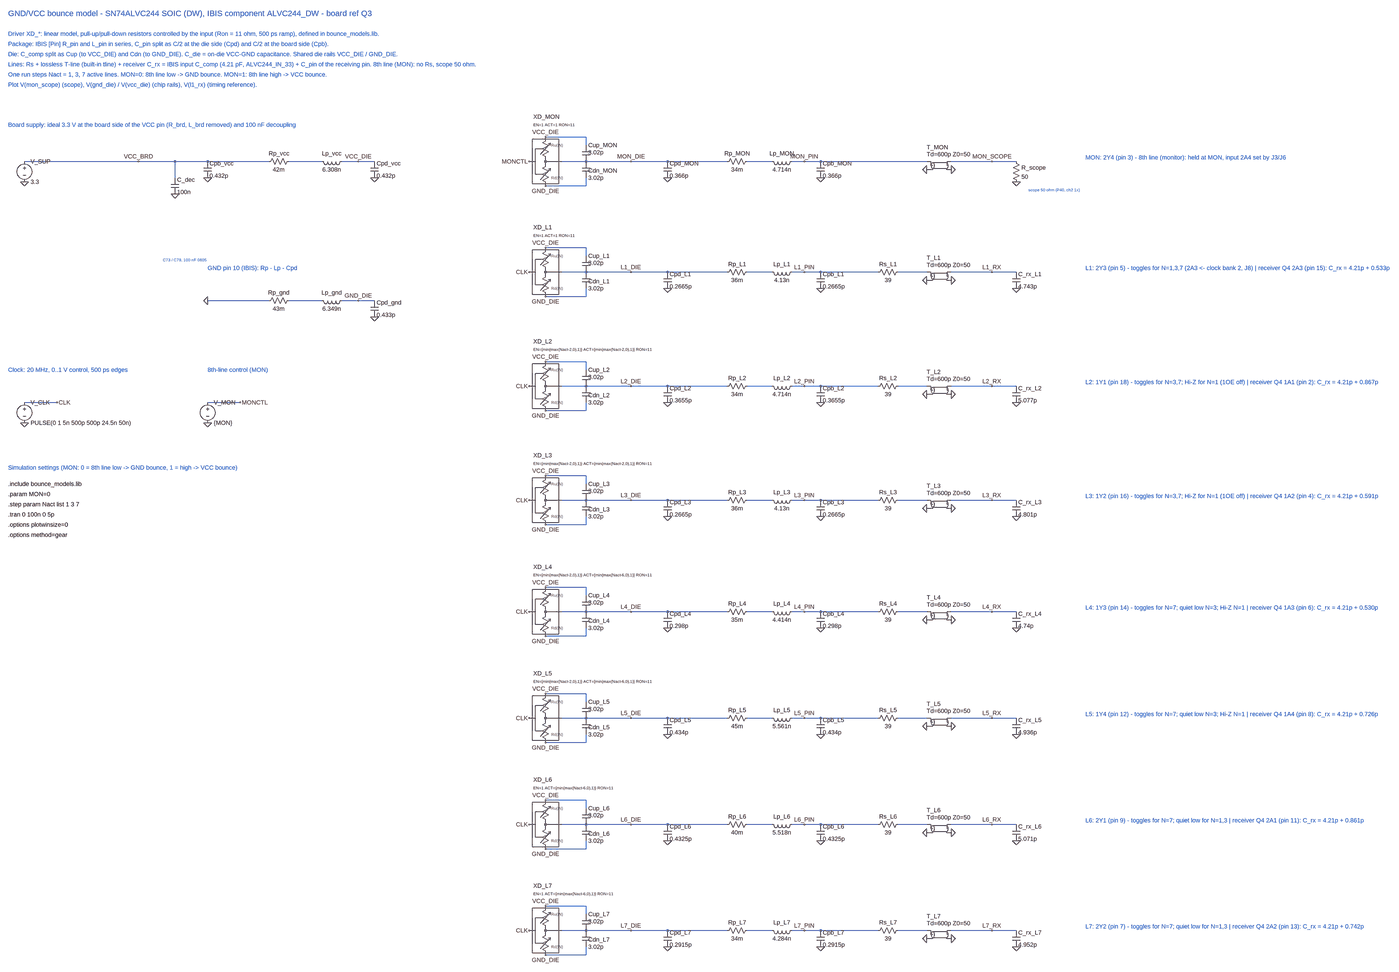
[diagram p0: schematic GND_VCC_bounce_SOIC.asc, whole sheet]
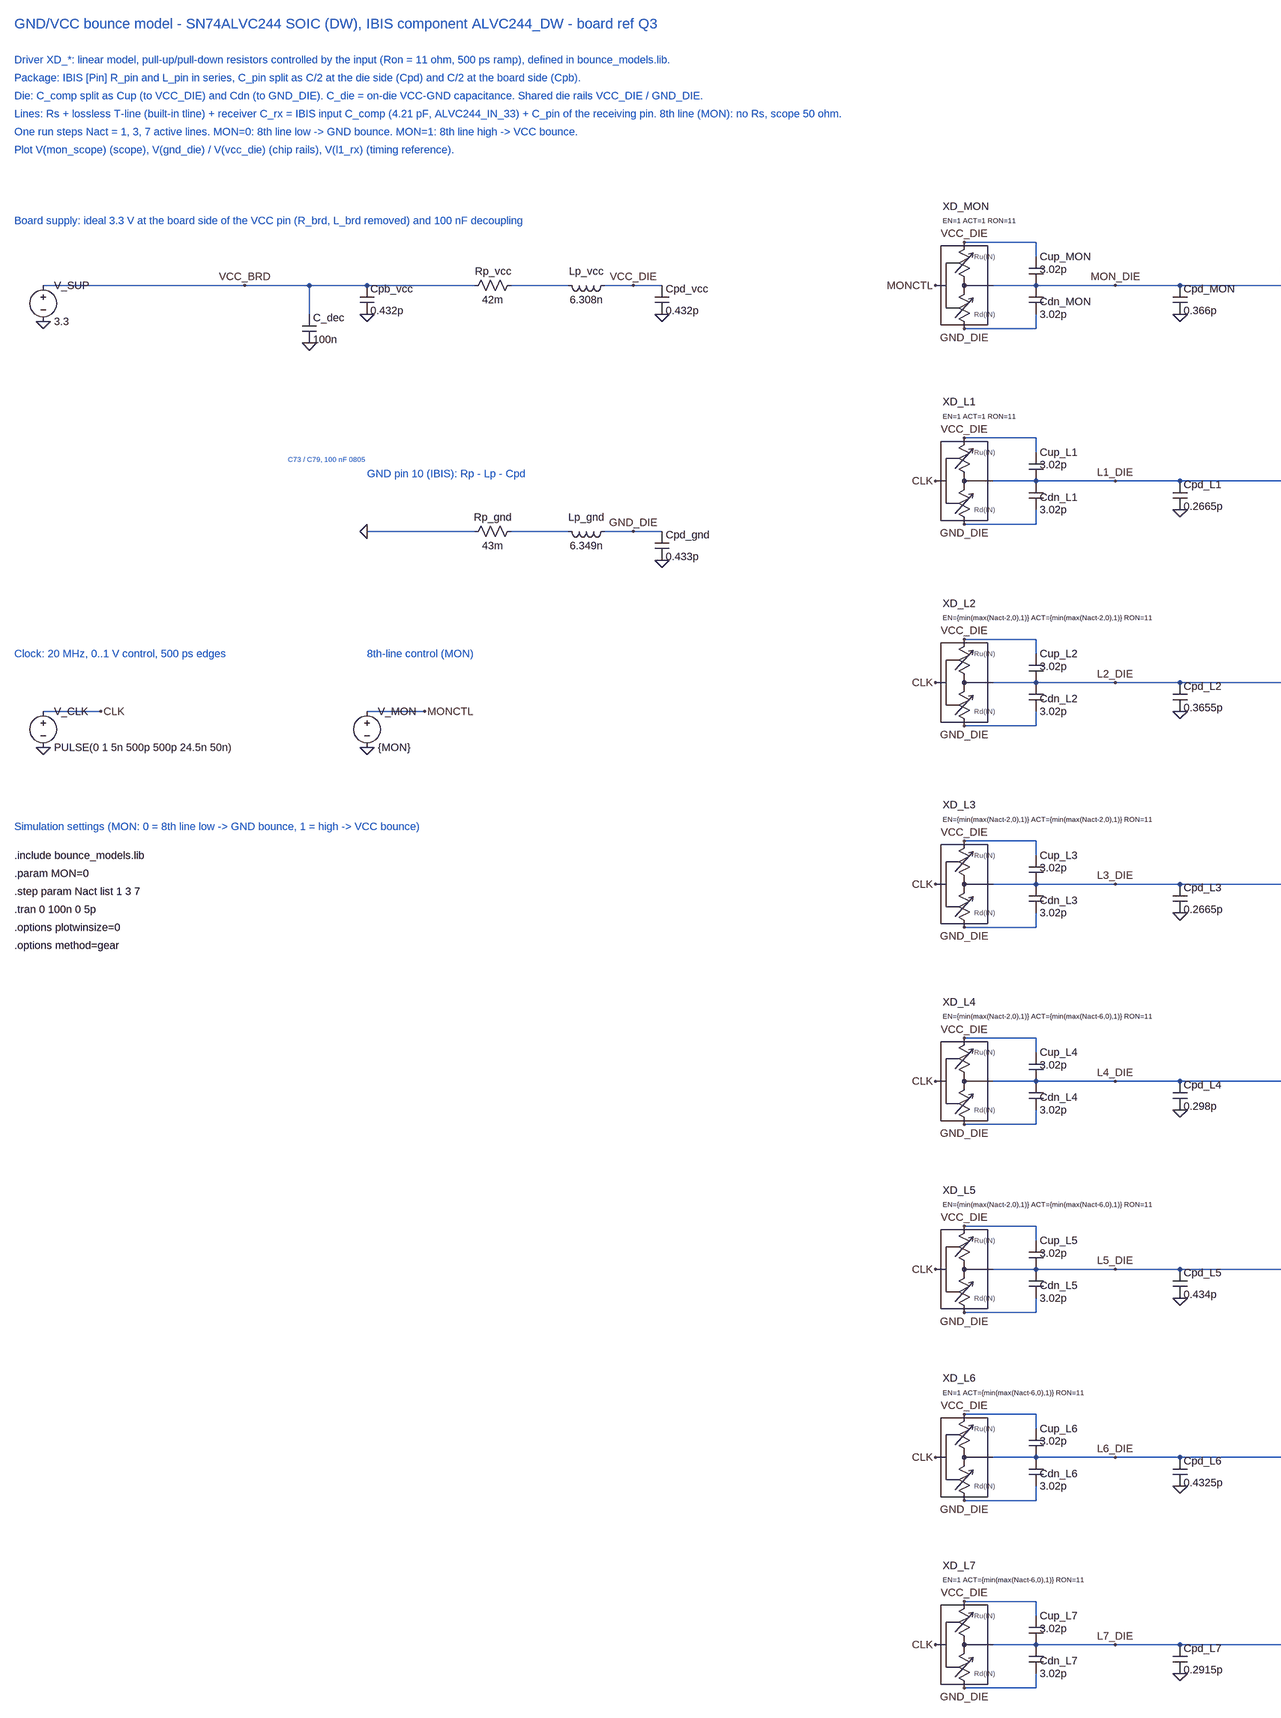
[diagram p1: schematic GND_VCC_bounce_SOIC.asc, part, row 1 of 1, column 1 of 2]
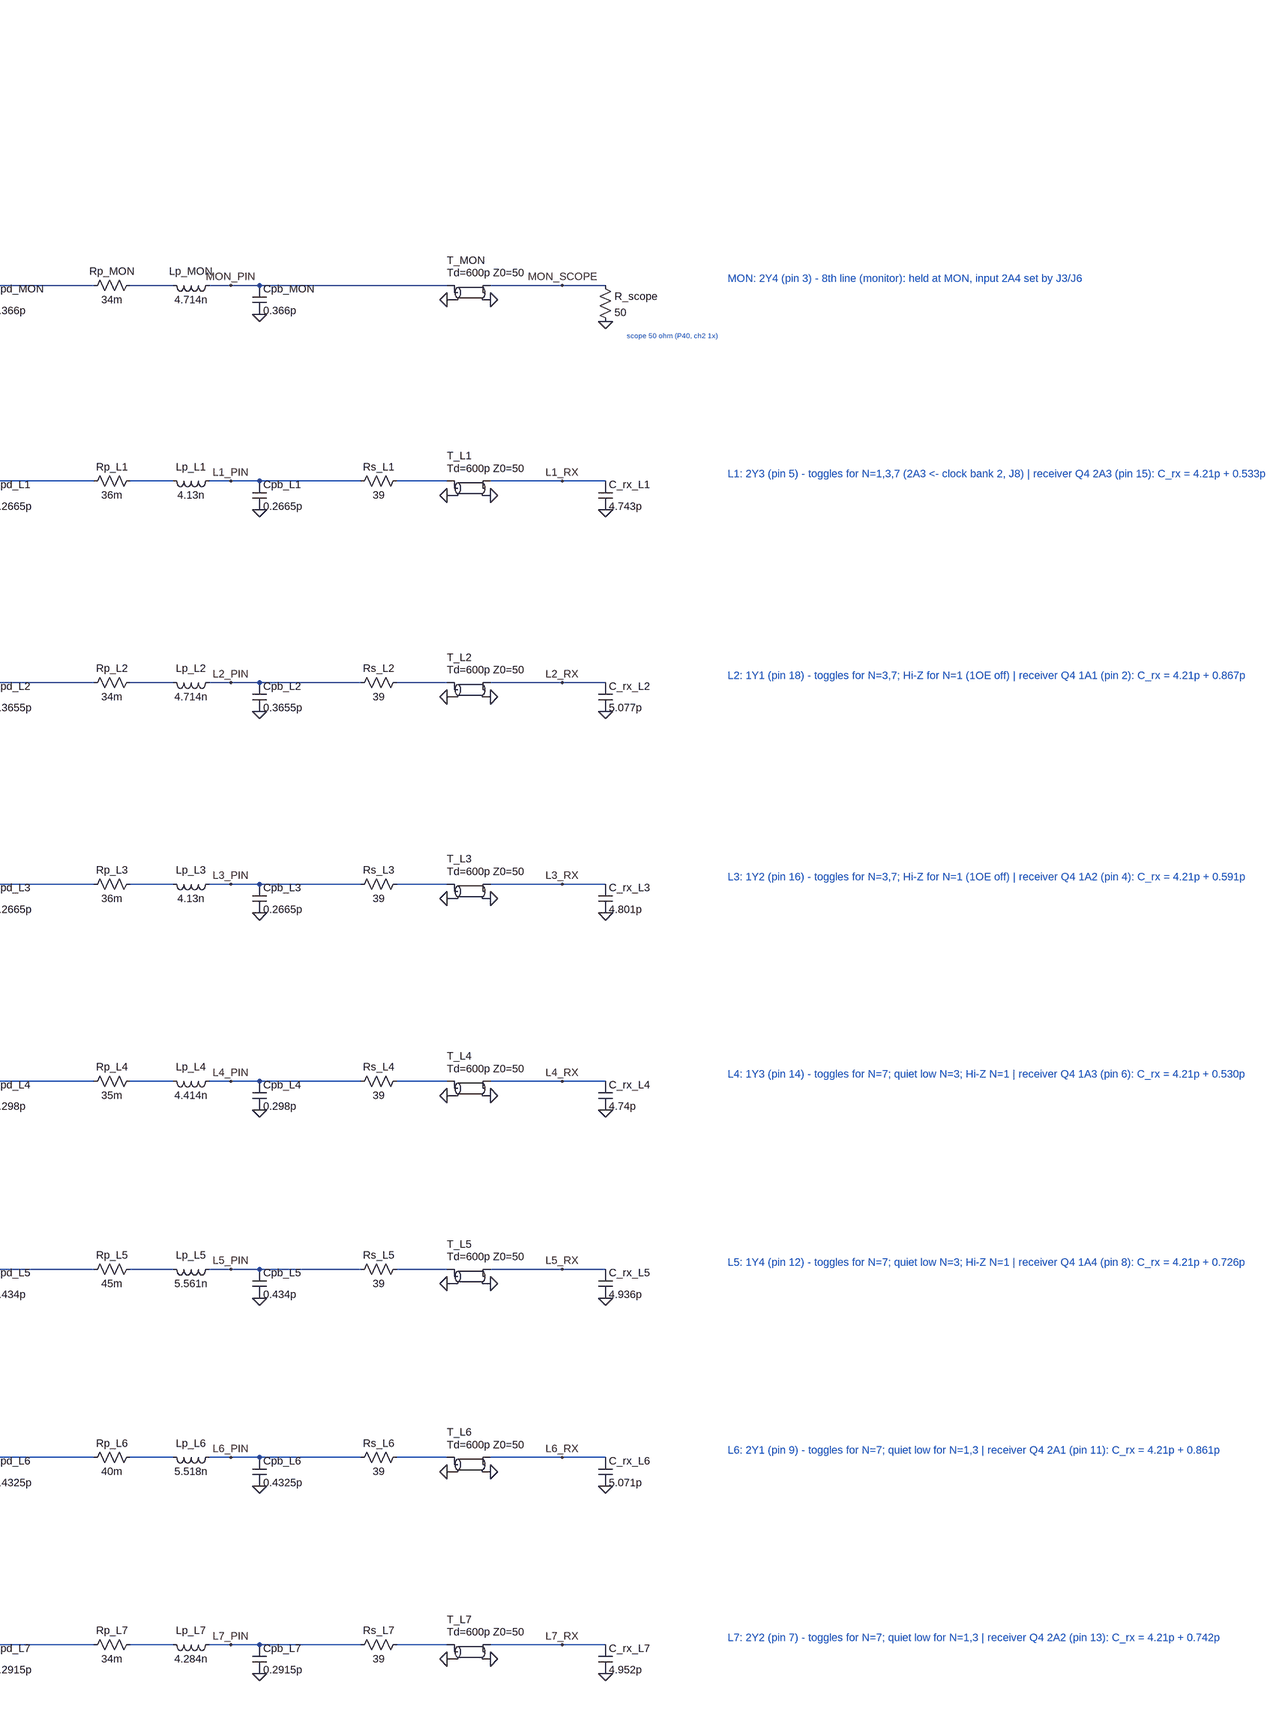
[diagram p2: schematic GND_VCC_bounce_SOIC.asc, part, row 1 of 1, column 2 of 2]
GND_VCC_bounce_SOIC.asc, the LTspice schematic file:
Version 4.1
SHEET 1 5576 3600
WIRE 2272 64 2112 64
WIRE 2272 96 2272 64
WIRE 512 160 64 160
WIRE 656 160 512 160
WIRE 784 160 656 160
WIRE 1024 160 784 160
WIRE 1232 160 1104 160
WIRE 1376 160 1312 160
WIRE 1440 160 1376 160
WIRE 2272 160 2176 160
WIRE 2448 160 2272 160
WIRE 2592 160 2448 160
WIRE 2832 160 2592 160
WIRE 3008 160 2912 160
WIRE 3136 160 3088 160
WIRE 3200 160 3136 160
WIRE 3632 160 3200 160
WIRE 3888 160 3728 160
WIRE 3984 160 3888 160
WIRE 656 224 656 160
WIRE 2272 256 2272 224
WIRE 2272 256 2112 256
WIRE 2272 512 2112 512
WIRE 2272 544 2272 512
WIRE 2272 608 2176 608
WIRE 2448 608 2272 608
WIRE 2592 608 2448 608
WIRE 2832 608 2592 608
WIRE 3008 608 2912 608
WIRE 3136 608 3088 608
WIRE 3200 608 3136 608
WIRE 3440 608 3200 608
WIRE 3632 608 3520 608
WIRE 3888 608 3728 608
WIRE 3984 608 3888 608
WIRE 2272 704 2272 672
WIRE 2272 704 2112 704
WIRE 1024 720 784 720
WIRE 1232 720 1104 720
WIRE 1376 720 1312 720
WIRE 1440 720 1376 720
WIRE 2272 960 2112 960
WIRE 2272 992 2272 960
WIRE 2272 1056 2176 1056
WIRE 2448 1056 2272 1056
WIRE 2592 1056 2448 1056
WIRE 2832 1056 2592 1056
WIRE 3008 1056 2912 1056
WIRE 3136 1056 3088 1056
WIRE 3200 1056 3136 1056
WIRE 3440 1056 3200 1056
WIRE 3632 1056 3520 1056
WIRE 3888 1056 3728 1056
WIRE 3984 1056 3888 1056
WIRE 192 1120 64 1120
WIRE 912 1120 784 1120
WIRE 2272 1152 2272 1120
WIRE 2272 1152 2112 1152
WIRE 2272 1408 2112 1408
WIRE 2272 1440 2272 1408
WIRE 2272 1504 2176 1504
WIRE 2448 1504 2272 1504
WIRE 2592 1504 2448 1504
WIRE 2832 1504 2592 1504
WIRE 3008 1504 2912 1504
WIRE 3136 1504 3088 1504
WIRE 3200 1504 3136 1504
WIRE 3440 1504 3200 1504
WIRE 3632 1504 3520 1504
WIRE 3888 1504 3728 1504
WIRE 3984 1504 3888 1504
WIRE 2272 1600 2272 1568
WIRE 2272 1600 2112 1600
WIRE 2272 1856 2112 1856
WIRE 2272 1888 2272 1856
WIRE 2272 1952 2176 1952
WIRE 2448 1952 2272 1952
WIRE 2592 1952 2448 1952
WIRE 2832 1952 2592 1952
WIRE 3008 1952 2912 1952
WIRE 3136 1952 3088 1952
WIRE 3200 1952 3136 1952
WIRE 3440 1952 3200 1952
WIRE 3632 1952 3520 1952
WIRE 3888 1952 3728 1952
WIRE 3984 1952 3888 1952
WIRE 2272 2048 2272 2016
WIRE 2272 2048 2112 2048
WIRE 2272 2304 2112 2304
WIRE 2272 2336 2272 2304
WIRE 2272 2400 2176 2400
WIRE 2448 2400 2272 2400
WIRE 2592 2400 2448 2400
WIRE 2832 2400 2592 2400
WIRE 3008 2400 2912 2400
WIRE 3136 2400 3088 2400
WIRE 3200 2400 3136 2400
WIRE 3440 2400 3200 2400
WIRE 3632 2400 3520 2400
WIRE 3888 2400 3728 2400
WIRE 3984 2400 3888 2400
WIRE 2272 2496 2272 2464
WIRE 2272 2496 2112 2496
WIRE 2272 2752 2112 2752
WIRE 2272 2784 2272 2752
WIRE 2272 2848 2176 2848
WIRE 2448 2848 2272 2848
WIRE 2592 2848 2448 2848
WIRE 2832 2848 2592 2848
WIRE 3008 2848 2912 2848
WIRE 3136 2848 3088 2848
WIRE 3200 2848 3136 2848
WIRE 3440 2848 3200 2848
WIRE 3632 2848 3520 2848
WIRE 3888 2848 3728 2848
WIRE 3984 2848 3888 2848
WIRE 2272 2944 2272 2912
WIRE 2272 2944 2112 2944
WIRE 2272 3200 2112 3200
WIRE 2272 3232 2272 3200
WIRE 2272 3296 2176 3296
WIRE 2448 3296 2272 3296
WIRE 2592 3296 2448 3296
WIRE 2832 3296 2592 3296
WIRE 3008 3296 2912 3296
WIRE 3136 3296 3088 3296
WIRE 3200 3296 3136 3296
WIRE 3440 3296 3200 3296
WIRE 3632 3296 3520 3296
WIRE 3888 3296 3728 3296
WIRE 3984 3296 3888 3296
WIRE 2272 3392 2272 3360
WIRE 2272 3392 2112 3392
FLAG 64 240 0
FLAG 512 160 VCC_BRD
FLAG 656 288 0
FLAG 784 224 0
FLAG 1376 160 VCC_DIE
FLAG 1440 224 0
FLAG 784 720 0
FLAG 1376 720 GND_DIE
FLAG 1440 784 0
FLAG 64 1200 0
FLAG 192 1120 CLK
FLAG 784 1200 0
FLAG 912 1120 MONCTL
FLAG 2048 160 MONCTL
FLAG 2112 64 VCC_DIE
FLAG 2112 256 GND_DIE
FLAG 2448 160 MON_DIE
FLAG 2592 224 0
FLAG 3136 160 MON_PIN
FLAG 3200 224 0
FLAG 3632 192 0
FLAG 3728 192 0
FLAG 3888 160 MON_SCOPE
FLAG 3984 240 0
FLAG 2048 608 CLK
FLAG 2112 512 VCC_DIE
FLAG 2112 704 GND_DIE
FLAG 2448 608 L1_DIE
FLAG 2592 672 0
FLAG 3136 608 L1_PIN
FLAG 3200 672 0
FLAG 3632 640 0
FLAG 3728 640 0
FLAG 3888 608 L1_RX
FLAG 3984 672 0
FLAG 2048 1056 CLK
FLAG 2112 960 VCC_DIE
FLAG 2112 1152 GND_DIE
FLAG 2448 1056 L2_DIE
FLAG 2592 1120 0
FLAG 3136 1056 L2_PIN
FLAG 3200 1120 0
FLAG 3632 1088 0
FLAG 3728 1088 0
FLAG 3888 1056 L2_RX
FLAG 3984 1120 0
FLAG 2048 1504 CLK
FLAG 2112 1408 VCC_DIE
FLAG 2112 1600 GND_DIE
FLAG 2448 1504 L3_DIE
FLAG 2592 1568 0
FLAG 3136 1504 L3_PIN
FLAG 3200 1568 0
FLAG 3632 1536 0
FLAG 3728 1536 0
FLAG 3888 1504 L3_RX
FLAG 3984 1568 0
FLAG 2048 1952 CLK
FLAG 2112 1856 VCC_DIE
FLAG 2112 2048 GND_DIE
FLAG 2448 1952 L4_DIE
FLAG 2592 2016 0
FLAG 3136 1952 L4_PIN
FLAG 3200 2016 0
FLAG 3632 1984 0
FLAG 3728 1984 0
FLAG 3888 1952 L4_RX
FLAG 3984 2016 0
FLAG 2048 2400 CLK
FLAG 2112 2304 VCC_DIE
FLAG 2112 2496 GND_DIE
FLAG 2448 2400 L5_DIE
FLAG 2592 2464 0
FLAG 3136 2400 L5_PIN
FLAG 3200 2464 0
FLAG 3632 2432 0
FLAG 3728 2432 0
FLAG 3888 2400 L5_RX
FLAG 3984 2464 0
FLAG 2048 2848 CLK
FLAG 2112 2752 VCC_DIE
FLAG 2112 2944 GND_DIE
FLAG 2448 2848 L6_DIE
FLAG 2592 2912 0
FLAG 3136 2848 L6_PIN
FLAG 3200 2912 0
FLAG 3632 2880 0
FLAG 3728 2880 0
FLAG 3888 2848 L6_RX
FLAG 3984 2912 0
FLAG 2048 3296 CLK
FLAG 2112 3200 VCC_DIE
FLAG 2112 3392 GND_DIE
FLAG 2448 3296 L7_DIE
FLAG 2592 3360 0
FLAG 3136 3296 L7_PIN
FLAG 3200 3360 0
FLAG 3632 3328 0
FLAG 3728 3328 0
FLAG 3888 3296 L7_RX
FLAG 3984 3360 0
SYMBOL voltage 64 144 R0
SYMATTR InstName V_SUP
SYMATTR Value 3.3
SYMBOL cap 640 224 R0
SYMATTR InstName C_dec
SYMATTR Value 100n
SYMBOL cap 768 160 R0
SYMATTR InstName Cpb_vcc
SYMATTR Value 0.432p
SYMBOL res 1120 144 R90
WINDOW 0 0 56 VBottom 2
WINDOW 3 32 56 VTop 2
SYMATTR InstName Rp_vcc
SYMATTR Value 42m
SYMBOL ind 1328 144 R90
WINDOW 0 0 56 VBottom 2
WINDOW 3 32 56 VTop 2
SYMATTR InstName Lp_vcc
SYMATTR Value 6.308n
SYMBOL cap 1424 160 R0
SYMATTR InstName Cpd_vcc
SYMATTR Value 0.432p
SYMBOL res 1120 704 R90
WINDOW 0 0 56 VBottom 2
WINDOW 3 32 56 VTop 2
SYMATTR InstName Rp_gnd
SYMATTR Value 43m
SYMBOL ind 1328 704 R90
WINDOW 0 0 56 VBottom 2
WINDOW 3 32 56 VTop 2
SYMATTR InstName Lp_gnd
SYMATTR Value 6.349n
SYMBOL cap 1424 720 R0
SYMATTR InstName Cpd_gnd
SYMATTR Value 0.433p
SYMBOL voltage 64 1104 R0
SYMATTR InstName V_CLK
SYMATTR Value PULSE(0 1 5n 500p 500p 24.5n 50n)
SYMBOL voltage 784 1104 R0
SYMATTR InstName V_MON
SYMATTR Value {MON}
SYMBOL drv 2112 160 R0
SYMATTR InstName XD_MON
SYMBOL cap 2256 160 R0
WINDOW 0 24 36 Left 2
WINDOW 3 24 64 Left 2
SYMATTR InstName Cdn_MON
SYMATTR Value 3.02p
SYMBOL cap 2256 96 R0
WINDOW 0 24 0 Left 2
WINDOW 3 24 28 Left 2
SYMATTR InstName Cup_MON
SYMATTR Value 3.02p
SYMBOL cap 2576 160 R0
SYMATTR InstName Cpd_MON
SYMATTR Value 0.366p
SYMBOL res 2928 144 R90
WINDOW 0 0 56 VBottom 2
WINDOW 3 32 56 VTop 2
SYMATTR InstName Rp_MON
SYMATTR Value 34m
SYMBOL ind 3104 144 R90
WINDOW 0 0 56 VBottom 2
WINDOW 3 32 56 VTop 2
SYMATTR InstName Lp_MON
SYMATTR Value 4.714n
SYMBOL cap 3184 160 R0
SYMATTR InstName Cpb_MON
SYMATTR Value 0.366p
SYMBOL tline 3680 176 R0
WINDOW 0 -48 -72 Left 2
WINDOW 3 -48 -44 Left 2
SYMATTR InstName T_MON
SYMATTR Value Td=600p Z0=50
SYMBOL res 3968 144 R0
SYMATTR InstName R_scope
SYMATTR Value 50
SYMBOL drv 2112 608 R0
SYMATTR InstName XD_L1
SYMBOL cap 2256 608 R0
WINDOW 0 24 36 Left 2
WINDOW 3 24 64 Left 2
SYMATTR InstName Cdn_L1
SYMATTR Value 3.02p
SYMBOL cap 2256 544 R0
WINDOW 0 24 0 Left 2
WINDOW 3 24 28 Left 2
SYMATTR InstName Cup_L1
SYMATTR Value 3.02p
SYMBOL cap 2576 608 R0
SYMATTR InstName Cpd_L1
SYMATTR Value 0.2665p
SYMBOL res 2928 592 R90
WINDOW 0 0 56 VBottom 2
WINDOW 3 32 56 VTop 2
SYMATTR InstName Rp_L1
SYMATTR Value 36m
SYMBOL ind 3104 592 R90
WINDOW 0 0 56 VBottom 2
WINDOW 3 32 56 VTop 2
SYMATTR InstName Lp_L1
SYMATTR Value 4.13n
SYMBOL cap 3184 608 R0
SYMATTR InstName Cpb_L1
SYMATTR Value 0.2665p
SYMBOL res 3536 592 R90
WINDOW 0 0 56 VBottom 2
WINDOW 3 32 56 VTop 2
SYMATTR InstName Rs_L1
SYMATTR Value 39
SYMBOL tline 3680 624 R0
WINDOW 0 -48 -72 Left 2
WINDOW 3 -48 -44 Left 2
SYMATTR InstName T_L1
SYMATTR Value Td=600p Z0=50
SYMBOL cap 3968 608 R0
SYMATTR InstName C_rx_L1
SYMATTR Value 4.743p
SYMBOL drv 2112 1056 R0
SYMATTR InstName XD_L2
SYMATTR SpiceLine EN={min(max(Nact-2,0),1)} ACT={min(max(Nact-2,0),1)} RON=11
SYMBOL cap 2256 1056 R0
WINDOW 0 24 36 Left 2
WINDOW 3 24 64 Left 2
SYMATTR InstName Cdn_L2
SYMATTR Value 3.02p
SYMBOL cap 2256 992 R0
WINDOW 0 24 0 Left 2
WINDOW 3 24 28 Left 2
SYMATTR InstName Cup_L2
SYMATTR Value 3.02p
SYMBOL cap 2576 1056 R0
SYMATTR InstName Cpd_L2
SYMATTR Value 0.3655p
SYMBOL res 2928 1040 R90
WINDOW 0 0 56 VBottom 2
WINDOW 3 32 56 VTop 2
SYMATTR InstName Rp_L2
SYMATTR Value 34m
SYMBOL ind 3104 1040 R90
WINDOW 0 0 56 VBottom 2
WINDOW 3 32 56 VTop 2
SYMATTR InstName Lp_L2
SYMATTR Value 4.714n
SYMBOL cap 3184 1056 R0
SYMATTR InstName Cpb_L2
SYMATTR Value 0.3655p
SYMBOL res 3536 1040 R90
WINDOW 0 0 56 VBottom 2
WINDOW 3 32 56 VTop 2
SYMATTR InstName Rs_L2
SYMATTR Value 39
SYMBOL tline 3680 1072 R0
WINDOW 0 -48 -72 Left 2
WINDOW 3 -48 -44 Left 2
SYMATTR InstName T_L2
SYMATTR Value Td=600p Z0=50
SYMBOL cap 3968 1056 R0
SYMATTR InstName C_rx_L2
SYMATTR Value 5.077p
SYMBOL drv 2112 1504 R0
SYMATTR InstName XD_L3
SYMATTR SpiceLine EN={min(max(Nact-2,0),1)} ACT={min(max(Nact-2,0),1)} RON=11
SYMBOL cap 2256 1504 R0
WINDOW 0 24 36 Left 2
WINDOW 3 24 64 Left 2
SYMATTR InstName Cdn_L3
SYMATTR Value 3.02p
SYMBOL cap 2256 1440 R0
WINDOW 0 24 0 Left 2
WINDOW 3 24 28 Left 2
SYMATTR InstName Cup_L3
SYMATTR Value 3.02p
SYMBOL cap 2576 1504 R0
SYMATTR InstName Cpd_L3
SYMATTR Value 0.2665p
SYMBOL res 2928 1488 R90
WINDOW 0 0 56 VBottom 2
WINDOW 3 32 56 VTop 2
SYMATTR InstName Rp_L3
SYMATTR Value 36m
SYMBOL ind 3104 1488 R90
WINDOW 0 0 56 VBottom 2
WINDOW 3 32 56 VTop 2
SYMATTR InstName Lp_L3
SYMATTR Value 4.13n
SYMBOL cap 3184 1504 R0
SYMATTR InstName Cpb_L3
SYMATTR Value 0.2665p
SYMBOL res 3536 1488 R90
WINDOW 0 0 56 VBottom 2
WINDOW 3 32 56 VTop 2
SYMATTR InstName Rs_L3
SYMATTR Value 39
SYMBOL tline 3680 1520 R0
WINDOW 0 -48 -72 Left 2
WINDOW 3 -48 -44 Left 2
SYMATTR InstName T_L3
SYMATTR Value Td=600p Z0=50
SYMBOL cap 3968 1504 R0
SYMATTR InstName C_rx_L3
SYMATTR Value 4.801p
SYMBOL drv 2112 1952 R0
SYMATTR InstName XD_L4
SYMATTR SpiceLine EN={min(max(Nact-2,0),1)} ACT={min(max(Nact-6,0),1)} RON=11
SYMBOL cap 2256 1952 R0
WINDOW 0 24 36 Left 2
WINDOW 3 24 64 Left 2
SYMATTR InstName Cdn_L4
SYMATTR Value 3.02p
SYMBOL cap 2256 1888 R0
WINDOW 0 24 0 Left 2
WINDOW 3 24 28 Left 2
SYMATTR InstName Cup_L4
SYMATTR Value 3.02p
SYMBOL cap 2576 1952 R0
SYMATTR InstName Cpd_L4
SYMATTR Value 0.298p
SYMBOL res 2928 1936 R90
WINDOW 0 0 56 VBottom 2
WINDOW 3 32 56 VTop 2
SYMATTR InstName Rp_L4
SYMATTR Value 35m
SYMBOL ind 3104 1936 R90
WINDOW 0 0 56 VBottom 2
WINDOW 3 32 56 VTop 2
SYMATTR InstName Lp_L4
SYMATTR Value 4.414n
SYMBOL cap 3184 1952 R0
SYMATTR InstName Cpb_L4
SYMATTR Value 0.298p
SYMBOL res 3536 1936 R90
WINDOW 0 0 56 VBottom 2
WINDOW 3 32 56 VTop 2
SYMATTR InstName Rs_L4
SYMATTR Value 39
SYMBOL tline 3680 1968 R0
WINDOW 0 -48 -72 Left 2
WINDOW 3 -48 -44 Left 2
SYMATTR InstName T_L4
SYMATTR Value Td=600p Z0=50
SYMBOL cap 3968 1952 R0
SYMATTR InstName C_rx_L4
SYMATTR Value 4.74p
SYMBOL drv 2112 2400 R0
SYMATTR InstName XD_L5
SYMATTR SpiceLine EN={min(max(Nact-2,0),1)} ACT={min(max(Nact-6,0),1)} RON=11
SYMBOL cap 2256 2400 R0
WINDOW 0 24 36 Left 2
WINDOW 3 24 64 Left 2
SYMATTR InstName Cdn_L5
SYMATTR Value 3.02p
SYMBOL cap 2256 2336 R0
WINDOW 0 24 0 Left 2
WINDOW 3 24 28 Left 2
SYMATTR InstName Cup_L5
SYMATTR Value 3.02p
SYMBOL cap 2576 2400 R0
SYMATTR InstName Cpd_L5
SYMATTR Value 0.434p
SYMBOL res 2928 2384 R90
WINDOW 0 0 56 VBottom 2
WINDOW 3 32 56 VTop 2
SYMATTR InstName Rp_L5
SYMATTR Value 45m
SYMBOL ind 3104 2384 R90
WINDOW 0 0 56 VBottom 2
WINDOW 3 32 56 VTop 2
SYMATTR InstName Lp_L5
SYMATTR Value 5.561n
SYMBOL cap 3184 2400 R0
SYMATTR InstName Cpb_L5
SYMATTR Value 0.434p
SYMBOL res 3536 2384 R90
WINDOW 0 0 56 VBottom 2
WINDOW 3 32 56 VTop 2
SYMATTR InstName Rs_L5
SYMATTR Value 39
SYMBOL tline 3680 2416 R0
WINDOW 0 -48 -72 Left 2
WINDOW 3 -48 -44 Left 2
SYMATTR InstName T_L5
SYMATTR Value Td=600p Z0=50
SYMBOL cap 3968 2400 R0
SYMATTR InstName C_rx_L5
SYMATTR Value 4.936p
SYMBOL drv 2112 2848 R0
SYMATTR InstName XD_L6
SYMATTR SpiceLine EN=1 ACT={min(max(Nact-6,0),1)} RON=11
SYMBOL cap 2256 2848 R0
WINDOW 0 24 36 Left 2
WINDOW 3 24 64 Left 2
SYMATTR InstName Cdn_L6
SYMATTR Value 3.02p
SYMBOL cap 2256 2784 R0
WINDOW 0 24 0 Left 2
WINDOW 3 24 28 Left 2
SYMATTR InstName Cup_L6
SYMATTR Value 3.02p
SYMBOL cap 2576 2848 R0
SYMATTR InstName Cpd_L6
SYMATTR Value 0.4325p
SYMBOL res 2928 2832 R90
WINDOW 0 0 56 VBottom 2
WINDOW 3 32 56 VTop 2
SYMATTR InstName Rp_L6
SYMATTR Value 40m
SYMBOL ind 3104 2832 R90
WINDOW 0 0 56 VBottom 2
WINDOW 3 32 56 VTop 2
SYMATTR InstName Lp_L6
SYMATTR Value 5.518n
SYMBOL cap 3184 2848 R0
SYMATTR InstName Cpb_L6
SYMATTR Value 0.4325p
SYMBOL res 3536 2832 R90
WINDOW 0 0 56 VBottom 2
WINDOW 3 32 56 VTop 2
SYMATTR InstName Rs_L6
SYMATTR Value 39
SYMBOL tline 3680 2864 R0
WINDOW 0 -48 -72 Left 2
WINDOW 3 -48 -44 Left 2
SYMATTR InstName T_L6
SYMATTR Value Td=600p Z0=50
SYMBOL cap 3968 2848 R0
SYMATTR InstName C_rx_L6
SYMATTR Value 5.071p
SYMBOL drv 2112 3296 R0
SYMATTR InstName XD_L7
SYMATTR SpiceLine EN=1 ACT={min(max(Nact-6,0),1)} RON=11
SYMBOL cap 2256 3296 R0
WINDOW 0 24 36 Left 2
WINDOW 3 24 64 Left 2
SYMATTR InstName Cdn_L7
SYMATTR Value 3.02p
SYMBOL cap 2256 3232 R0
WINDOW 0 24 0 Left 2
WINDOW 3 24 28 Left 2
SYMATTR InstName Cup_L7
SYMATTR Value 3.02p
SYMBOL cap 2576 3296 R0
SYMATTR InstName Cpd_L7
SYMATTR Value 0.2915p
SYMBOL res 2928 3280 R90
WINDOW 0 0 56 VBottom 2
WINDOW 3 32 56 VTop 2
SYMATTR InstName Rp_L7
SYMATTR Value 34m
SYMBOL ind 3104 3280 R90
WINDOW 0 0 56 VBottom 2
WINDOW 3 32 56 VTop 2
SYMATTR InstName Lp_L7
SYMATTR Value 4.284n
SYMBOL cap 3184 3296 R0
SYMATTR InstName Cpb_L7
SYMATTR Value 0.2915p
SYMBOL res 3536 3280 R90
WINDOW 0 0 56 VBottom 2
WINDOW 3 32 56 VTop 2
SYMATTR InstName Rs_L7
SYMATTR Value 39
SYMBOL tline 3680 3312 R0
WINDOW 0 -48 -72 Left 2
WINDOW 3 -48 -44 Left 2
SYMATTR InstName T_L7
SYMATTR Value Td=600p Z0=50
SYMBOL cap 3968 3296 R0
SYMATTR InstName C_rx_L7
SYMATTR Value 4.952p
TEXT 0 -480 Left 3 ;GND/VCC bounce model - SN74ALVC244 SOIC (DW), IBIS component ALVC244_DW - board ref Q3
TEXT 0 -400 Left 2 ;Driver XD_*: linear model, pull-up/pull-down resistors controlled by the input (Ron = 11 ohm, 500 ps ramp), defined in bounce_models.lib.
TEXT 0 -360 Left 2 ;Package: IBIS [Pin] R_pin and L_pin in series, C_pin split as C/2 at the die side (Cpd) and C/2 at the board side (Cpb).
TEXT 0 -320 Left 2 ;Die: C_comp split as Cup (to VCC_DIE) and Cdn (to GND_DIE). C_die = on-die VCC-GND capacitance. Shared die rails VCC_DIE / GND_DIE.
TEXT 0 -280 Left 2 ;Lines: Rs + lossless T-line (built-in tline) + receiver C_rx = IBIS input C_comp (4.21 pF, ALVC244_IN_33) + C_pin of the receiving pin. 8th line (MON): no Rs, scope 50 ohm.
TEXT 0 -240 Left 2 ;One run steps Nact = 1, 3, 7 active lines. MON=0: 8th line low -> GND bounce. MON=1: 8th line high -> VCC bounce.
TEXT 0 -200 Left 2 ;Plot V(mon_scope) (scope), V(gnd_die) / V(vcc_die) (chip rails), V(l1_rx) (timing reference).
TEXT 0 16 Left 2 ;Board supply: ideal 3.3 V at the board side of the VCC pin (R_brd, L_brd removed) and 100 nF decoupling
TEXT 608 560 Left 1 ;C73 / C79, 100 nF 0805
TEXT 784 592 Left 2 ;GND pin 10 (IBIS): Rp - Lp - Cpd
TEXT 0 992 Left 2 ;Clock: 20 MHz, 0..1 V control, 500 ps edges
TEXT 784 992 Left 2 ;8th-line control (MON)
TEXT 0 1376 Left 2 ;Simulation settings (MON: 0 = 8th line low -> GND bounce, 1 = high -> VCC bounce)
TEXT 0 1440 Left 2 !.include bounce_models.lib
TEXT 0 1480 Left 2 !.param MON=0
TEXT 0 1520 Left 2 !.step param Nact list 1 3 7
TEXT 0 1560 Left 2 !.tran 0 100n 0 5p
TEXT 0 1600 Left 2 !.options plotwinsize=0
TEXT 0 1640 Left 2 !.options method=gear
TEXT 4032 272 Left 1 ;scope 50 ohm (P40, ch2 1x)
TEXT 4256 144 Left 2 ;MON: 2Y4 (pin 3) - 8th line (monitor): held at MON, input 2A4 set by J3/J6
TEXT 4256 592 Left 2 ;L1: 2Y3 (pin 5) - toggles for N=1,3,7 (2A3 <- clock bank 2, J8) | receiver Q4 2A3 (pin 15): C_rx = 4.21p + 0.533p
TEXT 4256 1040 Left 2 ;L2: 1Y1 (pin 18) - toggles for N=3,7; Hi-Z for N=1 (1OE off) | receiver Q4 1A1 (pin 2): C_rx = 4.21p + 0.867p
TEXT 4256 1488 Left 2 ;L3: 1Y2 (pin 16) - toggles for N=3,7; Hi-Z for N=1 (1OE off) | receiver Q4 1A2 (pin 4): C_rx = 4.21p + 0.591p
TEXT 4256 1936 Left 2 ;L4: 1Y3 (pin 14) - toggles for N=7; quiet low N=3; Hi-Z N=1 | receiver Q4 1A3 (pin 6): C_rx = 4.21p + 0.530p
TEXT 4256 2384 Left 2 ;L5: 1Y4 (pin 12) - toggles for N=7; quiet low N=3; Hi-Z N=1 | receiver Q4 1A4 (pin 8): C_rx = 4.21p + 0.726p
TEXT 4256 2832 Left 2 ;L6: 2Y1 (pin 9) - toggles for N=7; quiet low for N=1,3 | receiver Q4 2A1 (pin 11): C_rx = 4.21p + 0.861p
TEXT 4256 3280 Left 2 ;L7: 2Y2 (pin 7) - toggles for N=7; quiet low for N=1,3 | receiver Q4 2A2 (pin 13): C_rx = 4.21p + 0.742p

The netlist it stands for:
* GND_VCC_bounce_SOIC.asc
V_SUP VCC_BRD 0 3.3
C_dec VCC_BRD 0 100n
Cpb_vcc VCC_BRD 0 0.432p
Rp_vcc N001 VCC_BRD 42m
Lp_vcc VCC_DIE N001 6.308n
Cpd_vcc VCC_DIE 0 0.432p
Rp_gnd N005 0 43m
Lp_gnd GND_DIE N005 6.349n
Cpd_gnd GND_DIE 0 0.433p
V_CLK CLK 0 PULSE(0 1 5n 500p 500p 24.5n 50n)
V_MON MONCTL 0 {MON}
X§XD_MON VCC_DIE GND_DIE MONCTL MON_DIE DRV EN=1 ACT=1 RON=11  ; pins VCCD GNDD IN OUT
Cdn_MON MON_DIE GND_DIE 3.02p
Cup_MON VCC_DIE MON_DIE 3.02p
Cpd_MON MON_DIE 0 0.366p
Rp_MON N002 MON_DIE 34m
Lp_MON MON_PIN N002 4.714n
Cpb_MON MON_PIN 0 0.366p
T_MON MON_PIN 0 MON_SCOPE 0 Td=600p Z0=50
R_scope MON_SCOPE 0 50
X§XD_L1 VCC_DIE GND_DIE CLK L1_DIE DRV EN=1 ACT=1 RON=11  ; pins VCCD GNDD IN OUT
Cdn_L1 L1_DIE GND_DIE 3.02p
Cup_L1 VCC_DIE L1_DIE 3.02p
Cpd_L1 L1_DIE 0 0.2665p
Rp_L1 N003 L1_DIE 36m
Lp_L1 L1_PIN N003 4.13n
Cpb_L1 L1_PIN 0 0.2665p
Rs_L1 N004 L1_PIN 39
T_L1 N004 0 L1_RX 0 Td=600p Z0=50
C_rx_L1 L1_RX 0 4.743p
X§XD_L2 VCC_DIE GND_DIE CLK L2_DIE DRV EN={min(max(Nact-2,0),1)} ACT={min(max(Nact-2,0),1)} RON=11  ; pins VCCD GNDD IN OUT
Cdn_L2 L2_DIE GND_DIE 3.02p
Cup_L2 VCC_DIE L2_DIE 3.02p
Cpd_L2 L2_DIE 0 0.3655p
Rp_L2 N006 L2_DIE 34m
Lp_L2 L2_PIN N006 4.714n
Cpb_L2 L2_PIN 0 0.3655p
Rs_L2 N007 L2_PIN 39
T_L2 N007 0 L2_RX 0 Td=600p Z0=50
C_rx_L2 L2_RX 0 5.077p
X§XD_L3 VCC_DIE GND_DIE CLK L3_DIE DRV EN={min(max(Nact-2,0),1)} ACT={min(max(Nact-2,0),1)} RON=11  ; pins VCCD GNDD IN OUT
Cdn_L3 L3_DIE GND_DIE 3.02p
Cup_L3 VCC_DIE L3_DIE 3.02p
Cpd_L3 L3_DIE 0 0.2665p
Rp_L3 N008 L3_DIE 36m
Lp_L3 L3_PIN N008 4.13n
Cpb_L3 L3_PIN 0 0.2665p
Rs_L3 N009 L3_PIN 39
T_L3 N009 0 L3_RX 0 Td=600p Z0=50
C_rx_L3 L3_RX 0 4.801p
X§XD_L4 VCC_DIE GND_DIE CLK L4_DIE DRV EN={min(max(Nact-2,0),1)} ACT={min(max(Nact-6,0),1)} RON=11  ; pins VCCD GNDD IN OUT
Cdn_L4 L4_DIE GND_DIE 3.02p
Cup_L4 VCC_DIE L4_DIE 3.02p
Cpd_L4 L4_DIE 0 0.298p
Rp_L4 N010 L4_DIE 35m
Lp_L4 L4_PIN N010 4.414n
Cpb_L4 L4_PIN 0 0.298p
Rs_L4 N011 L4_PIN 39
T_L4 N011 0 L4_RX 0 Td=600p Z0=50
C_rx_L4 L4_RX 0 4.74p
X§XD_L5 VCC_DIE GND_DIE CLK L5_DIE DRV EN={min(max(Nact-2,0),1)} ACT={min(max(Nact-6,0),1)} RON=11  ; pins VCCD GNDD IN OUT
Cdn_L5 L5_DIE GND_DIE 3.02p
Cup_L5 VCC_DIE L5_DIE 3.02p
Cpd_L5 L5_DIE 0 0.434p
Rp_L5 N012 L5_DIE 45m
Lp_L5 L5_PIN N012 5.561n
Cpb_L5 L5_PIN 0 0.434p
Rs_L5 N013 L5_PIN 39
T_L5 N013 0 L5_RX 0 Td=600p Z0=50
C_rx_L5 L5_RX 0 4.936p
X§XD_L6 VCC_DIE GND_DIE CLK L6_DIE DRV EN=1 ACT={min(max(Nact-6,0),1)} RON=11  ; pins VCCD GNDD IN OUT
Cdn_L6 L6_DIE GND_DIE 3.02p
Cup_L6 VCC_DIE L6_DIE 3.02p
Cpd_L6 L6_DIE 0 0.4325p
Rp_L6 N014 L6_DIE 40m
Lp_L6 L6_PIN N014 5.518n
Cpb_L6 L6_PIN 0 0.4325p
Rs_L6 N015 L6_PIN 39
T_L6 N015 0 L6_RX 0 Td=600p Z0=50
C_rx_L6 L6_RX 0 5.071p
X§XD_L7 VCC_DIE GND_DIE CLK L7_DIE DRV EN=1 ACT={min(max(Nact-6,0),1)} RON=11  ; pins VCCD GNDD IN OUT
Cdn_L7 L7_DIE GND_DIE 3.02p
Cup_L7 VCC_DIE L7_DIE 3.02p
Cpd_L7 L7_DIE 0 0.2915p
Rp_L7 N016 L7_DIE 34m
Lp_L7 L7_PIN N016 4.284n
Cpb_L7 L7_PIN 0 0.2915p
Rs_L7 N017 L7_PIN 39
T_L7 N017 0 L7_RX 0 Td=600p Z0=50
C_rx_L7 L7_RX 0 4.952p
* GND/VCC bounce model - SN74ALVC244 SOIC (DW), IBIS component ALVC244_DW - board ref Q3
* Driver XD_*: linear model, pull-up/pull-down resistors controlled by the input (Ron = 11 ohm, 500 ps ramp), defined in bounce_models.lib.
* Package: IBIS [Pin] R_pin and L_pin in series, C_pin split as C/2 at the die side (Cpd) and C/2 at the board side (Cpb).
* Die: C_comp split as Cup (to VCC_DIE) and Cdn (to GND_DIE). C_die = on-die VCC-GND capacitance. Shared die rails VCC_DIE / GND_DIE.
* Lines: Rs + lossless T-line (built-in tline) + receiver C_rx = IBIS input C_comp (4.21 pF, ALVC244_IN_33) + C_pin of the receiving pin. 8th line (MON): no Rs, scope 50 ohm.
* One run steps Nact = 1, 3, 7 active lines. MON=0: 8th line low -> GND bounce. MON=1: 8th line high -> VCC bounce.
* Plot V(mon_scope) (scope), V(gnd_die) / V(vcc_die) (chip rails), V(l1_rx) (timing reference).
* Board supply: ideal 3.3 V at the board side of the VCC pin (R_brd, L_brd removed) and 100 nF decoupling
* C73 / C79, 100 nF 0805
* GND pin 10 (IBIS): Rp - Lp - Cpd
* Clock: 20 MHz, 0..1 V control, 500 ps edges
* 8th-line control (MON)
* Simulation settings (MON: 0 = 8th line low -> GND bounce, 1 = high -> VCC bounce)
.include bounce_models.lib
.param MON=0
.step param Nact list 1 3 7
.tran 0 100n 0 5p
.options plotwinsize=0
.options method=gear
* scope 50 ohm (P40, ch2 1x)
* MON: 2Y4 (pin 3) - 8th line (monitor): held at MON, input 2A4 set by J3/J6
* L1: 2Y3 (pin 5) - toggles for N=1,3,7 (2A3 <- clock bank 2, J8) | receiver Q4 2A3 (pin 15): C_rx = 4.21p + 0.533p
* L2: 1Y1 (pin 18) - toggles for N=3,7; Hi-Z for N=1 (1OE off) | receiver Q4 1A1 (pin 2): C_rx = 4.21p + 0.867p
* L3: 1Y2 (pin 16) - toggles for N=3,7; Hi-Z for N=1 (1OE off) | receiver Q4 1A2 (pin 4): C_rx = 4.21p + 0.591p
* L4: 1Y3 (pin 14) - toggles for N=7; quiet low N=3; Hi-Z N=1 | receiver Q4 1A3 (pin 6): C_rx = 4.21p + 0.530p
* L5: 1Y4 (pin 12) - toggles for N=7; quiet low N=3; Hi-Z N=1 | receiver Q4 1A4 (pin 8): C_rx = 4.21p + 0.726p
* L6: 2Y1 (pin 9) - toggles for N=7; quiet low for N=1,3 | receiver Q4 2A1 (pin 11): C_rx = 4.21p + 0.861p
* L7: 2Y2 (pin 7) - toggles for N=7; quiet low for N=1,3 | receiver Q4 2A2 (pin 13): C_rx = 4.21p + 0.742p
.backanno
.end